# Altium schematic sheet FPGA_board_conn_pt3.SchDoc: JM3 TE0720 carrier connector
size A4; DocumentNumber: ADC-SCH-16; SheetNumber: 16; SheetTotal: 20
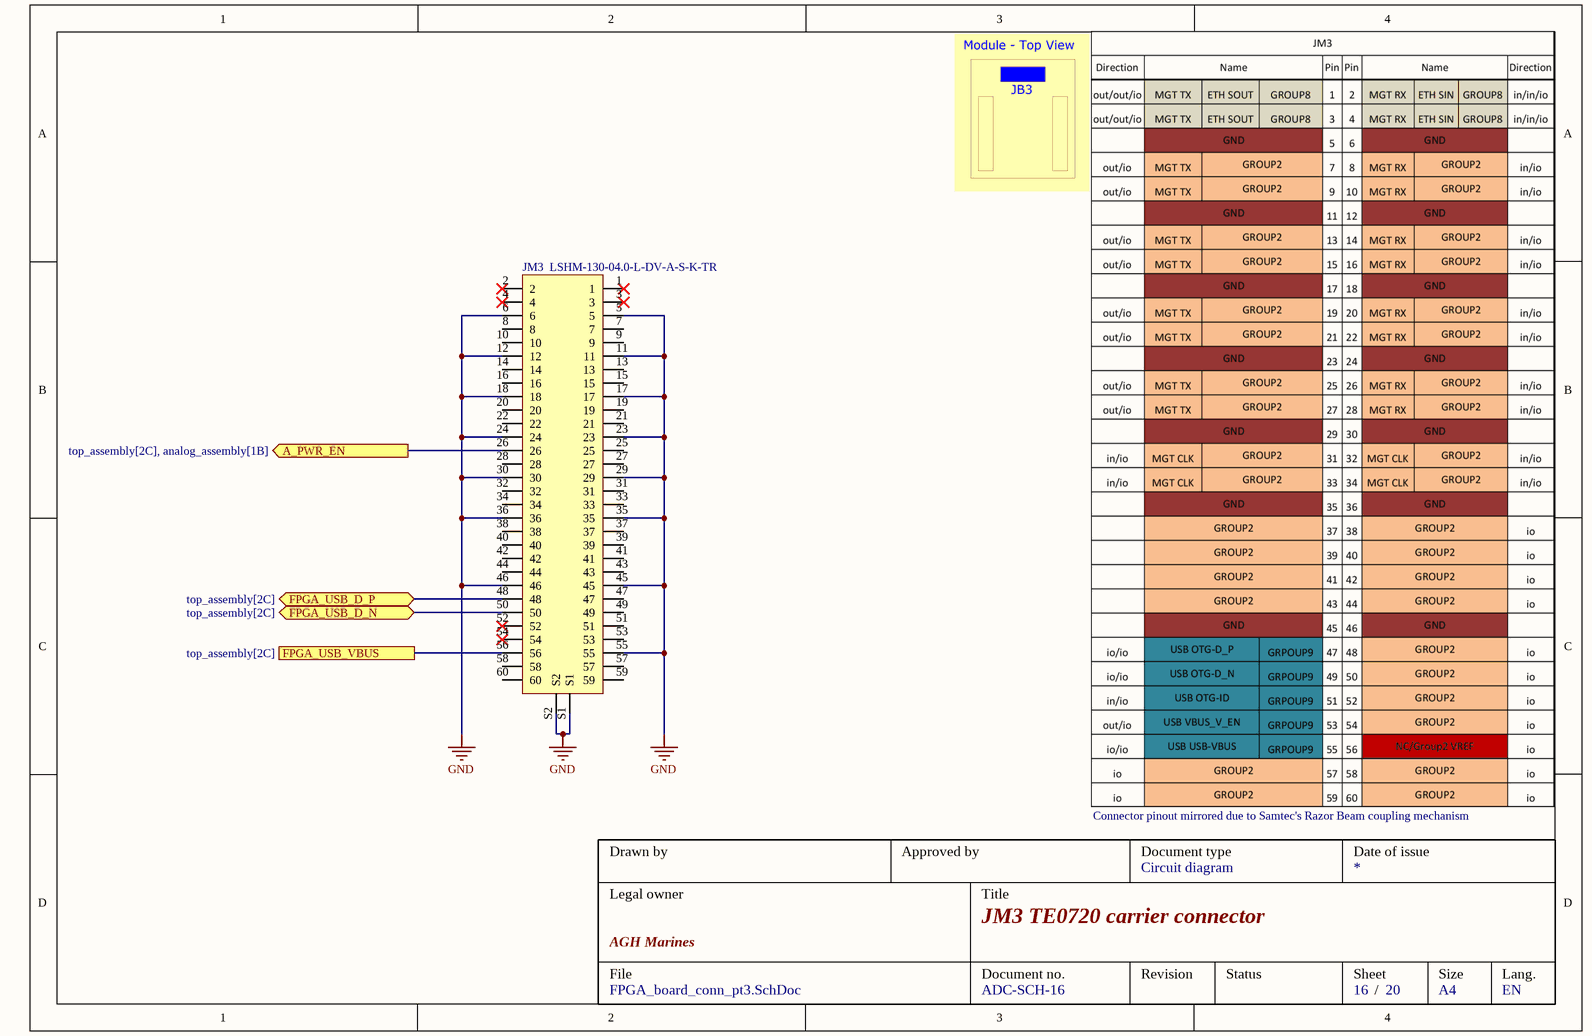
[diagram p0: FPGA_board_conn_pt3.SchDoc]

## Parts
JM3  LSHM-130-04.0-L-DV-A-S-K-TR  [CONS_LSHM-130-04.0-L-DV-A-S-TR]

## Ports
A_PWR_EN (out, see top_assembly[2C], analog_assembly[1B]), FPGA_USB_D_N (bidir, see top_assembly[2C]), FPGA_USB_D_P (bidir, see top_assembly[2C]), FPGA_USB_VBUS (see top_assembly[2C])

## Nets
GND: JM3.5 JM3.6 JM3.11 JM3.12 JM3.17 JM3.18 JM3.23 JM3.24 JM3.29 JM3.30 JM3.35 JM3.36 JM3.45 JM3.46 JM3.55 JM3.S1 JM3.S2
A_PWR_EN: JM3.26 ; port A_PWR_EN
FPGA_USB_D_N: JM3.50 ; port FPGA_USB_D_N
FPGA_USB_D_P: JM3.48 ; port FPGA_USB_D_P
FPGA_USB_VBUS: JM3.56 ; port FPGA_USB_VBUS

Not connected (* = marked no-connect by the designer): JM3 1* 2* 3* 4* 7 8 9 10 13 14 15 16 19 20 21 22 25 27 28 31 32 33 34 37 38 39 40 41 42 43 44 47 49 51 52* 53 54* 57 58 59 60

## Notes on the sheet
- Connector pinout mirrored due to Samtec's Razor Beam coupling mechanism
- Drawn by
- Approved by
- Document type
- Date of issue
- Legal owner
- Title
- Circuit diagram
- File
- AGH Marines
- Document no.
- Revision
- Status
- Sheet
- Size
- Lang.
- /
- A4
- EN

## Library data of the parts
JM3 = LSHM-130-04.0-L-DV-A-S-K-TR: Board to Board & Mezzanine Connectors 0.50 mm Razor Beam(TM) High-Speed Hermaphroditic Terminal/Socket Strip; Manufacturer: Samtec; Supplier 1: Mouser; Supplier Part Number 1: 200-LSHM15004.0LDVAS; ClassName: FPGA_Socket